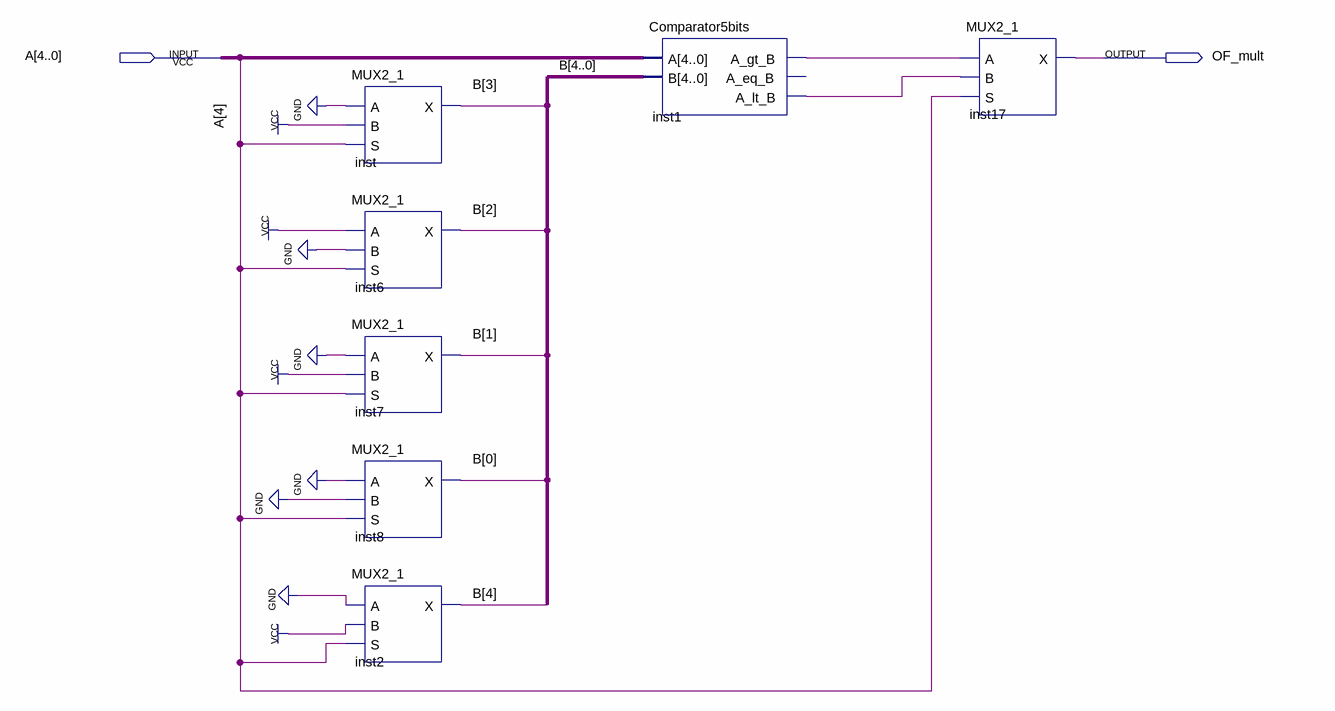
[diagram p0: schematic sheet]
// Quartus schematic OF_mult.bdf as structural Verilog: 7 symbols, 2 pins
module OF_mult (
  input  [4:0] A,
  output OF_mult
);

  wire inst1_a_gt_b, inst1_a_lt_b;
  wire [4:0] B;

  MUX2_1 inst (.A(1'b0), .B(1'b1), .S(A[4]), .X(B[3]));
  MUX2_1 inst6 (.A(1'b1), .B(1'b0), .S(A[4]), .X(B[2]));
  MUX2_1 inst7 (.A(1'b0), .B(1'b1), .S(A[4]), .X(B[1]));
  MUX2_1 inst8 (.A(1'b0), .B(1'b0), .S(A[4]), .X(B[0]));
  MUX2_1 inst2 (.A(1'b0), .B(1'b1), .S(A[4]), .X(B[4]));
  Comparator5bits inst1 (.A(A), .B(B), .A_gt_B(inst1_a_gt_b), .A_lt_B(inst1_a_lt_b));  // open: A_eq_B
  MUX2_1 inst17 (.A(inst1_a_gt_b), .B(inst1_a_lt_b), .S(A[4]), .X(OF_mult));
endmodule
